# Altium schematic sheet MCU.SchDoc
size A4; SheetNumber: 2; SheetTotal: 3
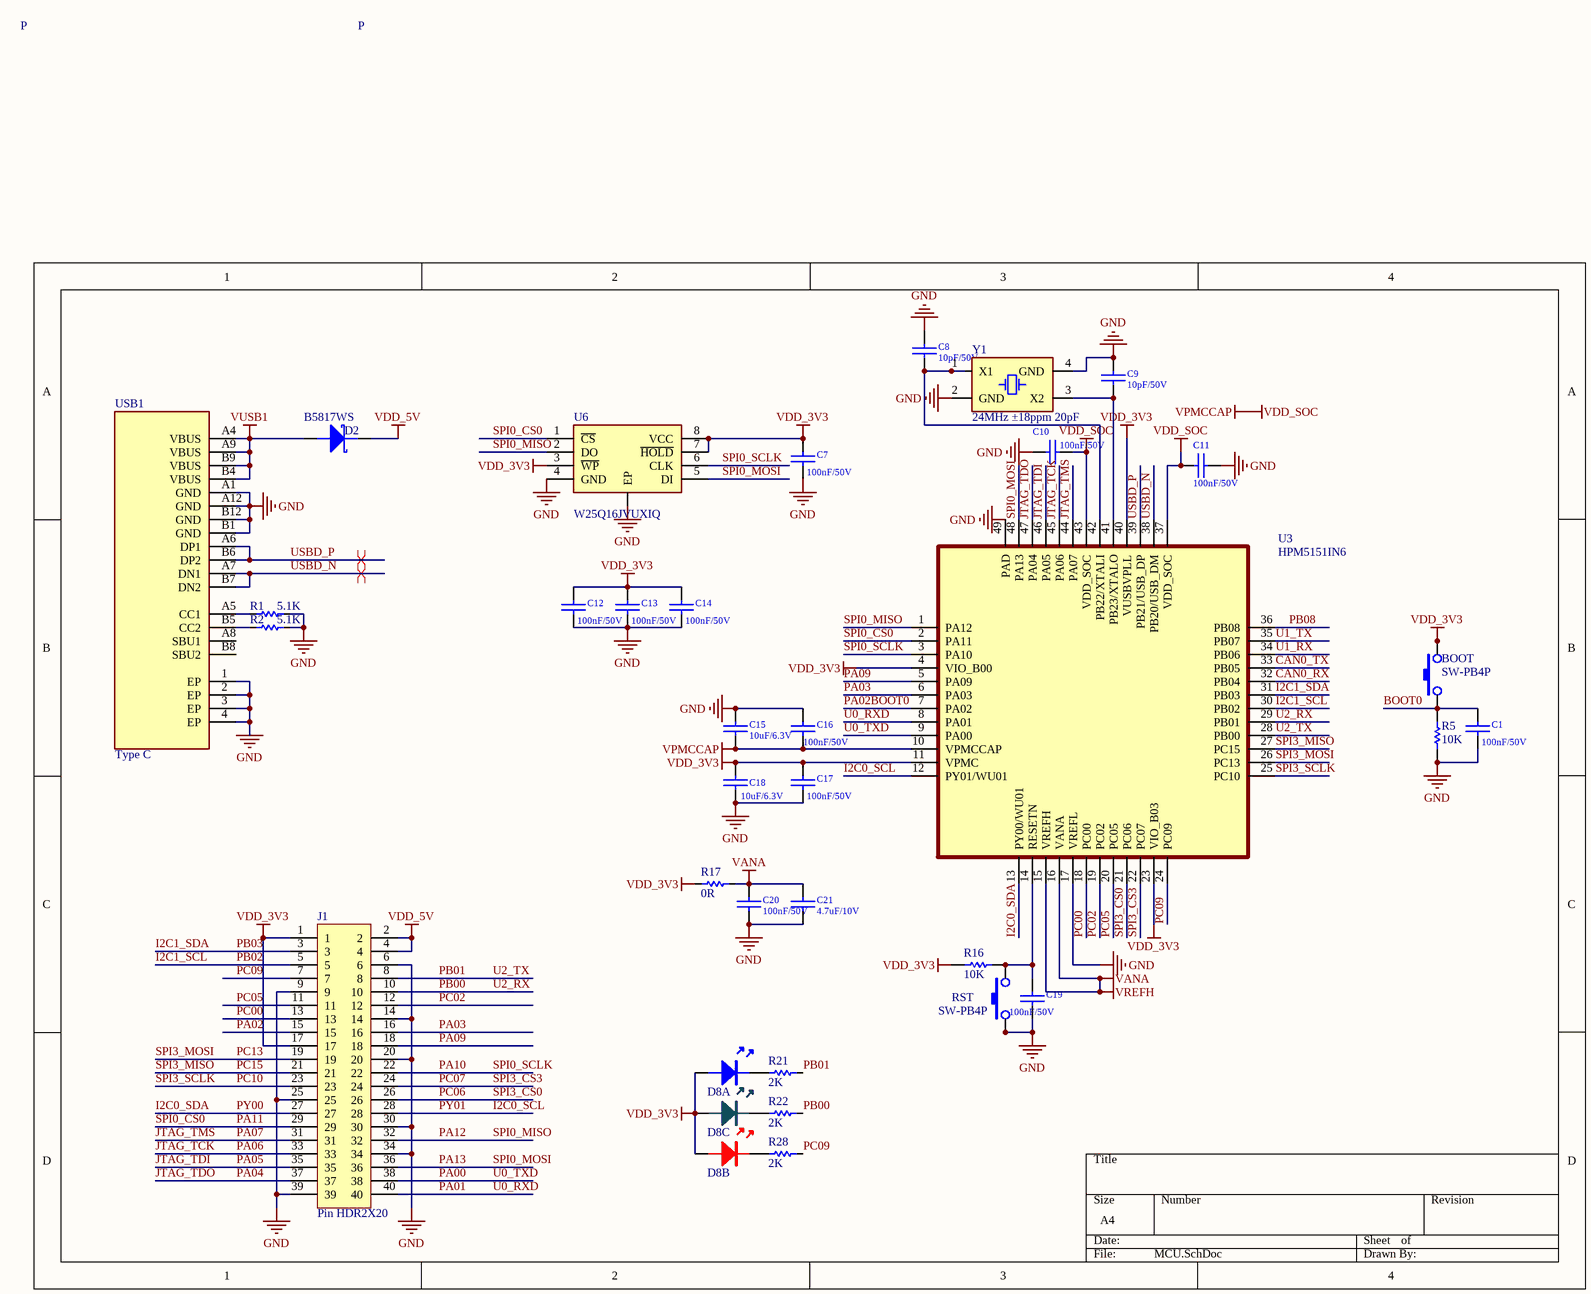
[diagram p0: MCU.SchDoc]

## Parts
BOOT  SW-PB4P  [SW-PB4P]
C1  100nF/50V  [C0402]
C7  100nF/50V  [C0402]
C8  10pF/50V  [C0402]
C9  10pF/50V  [C0402]
C10  100nF/50V  [C0402]
C11  100nF/50V  [C0402]
C12  100nF/50V  [C0402]
C13  100nF/50V  [C0402]
C14  100nF/50V  [C0402]
C15  10uF/6.3V  [C0402]
C16  100nF/50V  [C0402]
C17  100nF/50V  [C0402]
C18  10uF/6.3V  [C0402]
C19  100nF/50V  [C0402]
C20  100nF/50V  [C0402]
C21  4.7uF/10V  [C0402]
D2  B5817WS  [SOD-323]
D8  LED  [SMD_4P-L2.2-W2.1-BR]  (value not drawn)  (parts A,B,C of 3)
J1  Pin HDR2X20  [Pin HDR2X20/2.54mm-S]
R1  5.1K  [R0402]
R2  5.1K  [R0402]
R5  10K  [R0402]
R16  10K  [R0402]
R17  0R  [R0402]
R21  2K  [R0402]
R22  2K  [R0402]
R28  2K  [R0402]
RST  SW-PB4P  [SW-PB4P]
U3  HPM5151IN6  [QFN48 6*6]
U6  W25Q16JVUXIQ  [USON-8-EP(2x3)]
USB1  Type C  [TYPE-C-16PIN-CB1.6]
Y1  24MHz ±18ppm 20pF  [OSC 2016-4P]

## Nets
GND: C1.2 C7.2 C8.2 C9.2 C10.1 C11.2 C12.2 C13.2 C14.2 C15.2 C16.2 C17.2 C18.2 C19.2 C20.2 C21.2 J1.6 J1.9 J1.14 J1.20 J1.25 J1.30 J1.34 J1.39 R1.1 R2.1 R5.1 RST.3 RST.4 U3.17(VREFL) U3.49(PAD) U6.4(GND) U6.9(EP) USB1.1(EP) USB1.2(EP) USB1.3(EP) USB1.4(EP) USB1.A1(GND) USB1.A12(GND) USB1.B1(GND) USB1.B12(GND) Y1.2(GND) Y1.4(GND)
VANA: C20.1 C21.1 R17.1 U3.15(VREFH) U3.16(VANA)  [also labelled VREFH]
VDD_3V3: BOOT.3 BOOT.4 C7.1 C12.1 C13.1 C14.1 C17.1 C18.1 D8.1 J1.1 J1.17 R16.2 R17.2 U3.4(VIO_B00) U3.11(VPMC) U3.23(VIO_B03) U3.40(VUSBVPLL) U6.3(~{WP}) U6.7(~{HOLD}) U6.8(VCC)
VDD_5V: D2.K J1.2 J1.4
VDD_SOC: C10.2 C11.1 C15.1 C16.1 U3.10(VPMCCAP) U3.37(VDD_SOC) U3.43(VDD_SOC)  [also labelled VPMCCAP]
VUSB1: D2.A USB1.A4(VBUS) USB1.A9(VBUS) USB1.B4(VBUS) USB1.B9(VBUS)
BOOT0: BOOT.1 BOOT.2 C1.1 J1.15 R5.2 U3.7(PA02)  [also labelled PA02]
CAN0_RX: U3.32(PB04)
CAN0_TX: U3.33(PB05)
I2C0_SCL: J1.28 U3.12(PY01/WU01)  [also labelled PY01]
I2C0_SDA: J1.27 U3.13(PY00/WU01)  [also labelled PY00]
I2C1_SCL: J1.5 U3.30(PB02)  [also labelled PB02]
I2C1_SDA: J1.3 U3.31(PB03)  [also labelled PB03]
JTAG_TCK: J1.33 U3.45(PA06)  [also labelled PA06]
JTAG_TDI: J1.35 U3.46(PA05)  [also labelled PA05]
JTAG_TDO: J1.37 U3.47(PA04)  [also labelled PA04]
JTAG_TMS: J1.31 U3.44(PA07)  [also labelled PA07]
PA00: J1.38 U3.9(PA00)  [also labelled U0_TXD]
PA01: J1.40 U3.8(PA01)  [also labelled U0_RXD]
PA03: J1.16 U3.6(PA03)
PA09: J1.18 U3.5(PA09)
PA10: J1.22 U3.3(PA10) U6.6(CLK)  [also labelled SPI0_SCLK]
PA11: J1.29 U3.2(PA11) U6.1(~{CS})  [also labelled SPI0_CS0]
PA12: J1.32 U3.1(PA12) U6.2(DO)  [also labelled SPI0_MISO]
PA13: J1.36 U3.48(PA13) U6.5(DI)  [also labelled SPI0_MOSI]
PB00: J1.10 R22.1 U3.29(PB01)  [also labelled U2_RX]
PB01: J1.8 R21.1 U3.28(PB00)  [also labelled U2_TX]
PB08: U3.36(PB08)
PC00: J1.13 U3.18(PC00)
PC02: J1.12 U3.19(PC02)
PC05: J1.11 U3.20(PC05)
PC06: J1.26 U3.21(PC06)  [also labelled SPI3_CS0]
PC07: J1.24 U3.22(PC07)  [also labelled SPI3_CS3]
PC09: J1.7 R28.1 U3.24(PC09)
PC10: J1.23 U3.25(PC10)  [also labelled SPI3_SCLK]
PC13: J1.19 U3.26(PC13)  [also labelled SPI3_MOSI]
PC15: J1.21 U3.27(PC15)  [also labelled SPI3_MISO]
U1_RX: U3.34(PB06)
U1_TX: U3.35(PB07)
USBD_N: U3.38(PB20/USB_DM) USB1.A7(DN1) USB1.B7(DN2)
USBD_P: U3.39(PB21/USB_DP) USB1.A6(DP1) USB1.B6(DP2)
NetC8_1: C8.1 U3.42(PB22/XTALI) Y1.1(X1)
NetC9_1: C9.1 U3.41(PB23/XTALO) Y1.3(X2)
NetC19_1: C19.1 R16.1 RST.1 RST.2 U3.14(RESETN)
NetD8_2: D8.2 R28.2
NetD8_3: D8.3 R22.2
NetD8_4: D8.4 R21.2
NetR1_2: R1.2 USB1.A5(CC1)
NetR2_2: R2.2 USB1.B5(CC2)

Not connected (* = marked no-connect by the designer): USB1 A8(SBU1) B8(SBU2)

## Layout directives
differential pair: USBD_N, USBD_P

## Notes on the sheet
- P

## Library data of the parts
BOOT = SW-PB4P: Manufacturer: DEALON(德艺隆); PreferredModel: TD-1221SR-2.5H-250; Name: Switch; WeldingType: SMD; JCL-Code: C2905184; InternalNumbering: *
C1 C7 C10-C14 C16 C17 C19 C20 = Cap: Capacitor; Manufacturer: SAMSUNG(三星); PreferredModel: CL05B104KB54PNC; Name: Capacitance; WeldingType: SMD; JLC-Code: C307331
C8 C9 = Cap: Capacitor; Manufacturer: muRata(村田); PreferredModel: GRM1555C1H100FA01D; Name: Capacitance; WeldingType: SMD; JCL-Code: C161520
C15 C18 = Cap: Capacitor; Manufacturer: SAMSUNG; PreferredModel: CL05A106MQ5NUNC; Name: Capacitance; WeldingType: SMD; JCL-Code: C15525
C21 = Cap: Capacitor; Manufacturer: SAMSUNG; PreferredModel: CL05A475KP5NRNC; Name: Capacitance; WeldingType: SMD; JCL-Code: C368809
D2 = Schottky Diode: Manufacturer: R+O(宏嘉诚); WeldingType: SMD; PreferredModel: B5817WS; Name: Schottky Diode; InternalNumbering: *; JLC-Code: C7420329
D8 = LED_RGB: WeldingType: SMD; PreferredModel: *; Name: LED; Manufacturer: *; InternalNumbering: *; JLC-Code: *
R1 R2 R21 R22 R28 = Res: Resistance; WeldingType: SMD; Name: Resistance
  R1: JLC-Code: *
  R2 R21 R22 R28: JCL-Code: *
R5 = Res: Resistance; Manufacturer: YAGEO; PreferredModel: AC0402FR-0710KL; WeldingType: SMD; InternalNumbering: GRD1049; JCL-Code: C144807; Name: Resistance
R16 = Res: Resistance; Manufacturer: YAGEO; PreferredModel: AC0402FR-0710KL; WeldingType: SMD; Name: Resistance; JLC-Code: C144807
R17 = Res: Resistance; Manufacturer: UNI-ROYAL(厚声); PreferredModel: 0402WGF0000TCE; WeldingType: SMD; Name: Resistance; JLC-Code: *
RST = SW-PB4P: Manufacturer: DEALON(德艺隆); PreferredModel: TD-1221SR-2.5H-250; Name: Switch; WeldingType: SMD; InternalNumbering: *; JLC-Code: C2905184
U3 = HPM5151IN61_1: 32 bit RISC-V MCU; Manufacturer: HPMICRO Semiconductor; WeldingType: SMD; PreferredModel: HPM5151IN61; Name: 32 bit RISC-V MCU; InternalNumbering: *
U6 = W25Q16JVUXIQ: Serial flash memory with DUAL/QUAD SPI; Manufacturer: Winbond; WeldingType: SMD; PreferredModel: W25Q16JVUXIQ; Name: Serial flash memory; InternalNumbering: *; JCL-Code: *
USB1 = Type C: USB Type C; WeldingType: SMD; PreferredModel: *; Name: USB Type C; Manufacturer: *; InternalNumbering: *; JCL-Code: *
Y1 = XTAL_4P: Manufacturer: YXC(扬兴晶振); PreferredModel: XL7EL89COI-111YLC-24M; Name: Crystal oscillator; WeldingType: SMD; JCL-Code: C22434877; InternalNumbering: *